# Altium schematic sheet ISP2454-LX_Libraries.SchDoc: ISP2454-LX_SCH
size A3; Organization: Insight SIP; Address1: 400 Avenue de Roumanille; Address2: 06906; Address3: Sophia-Antipolis; Address4: France; DocumentNumber: 1; Revision: 2; SheetNumber: 1; SheetTotal: 1
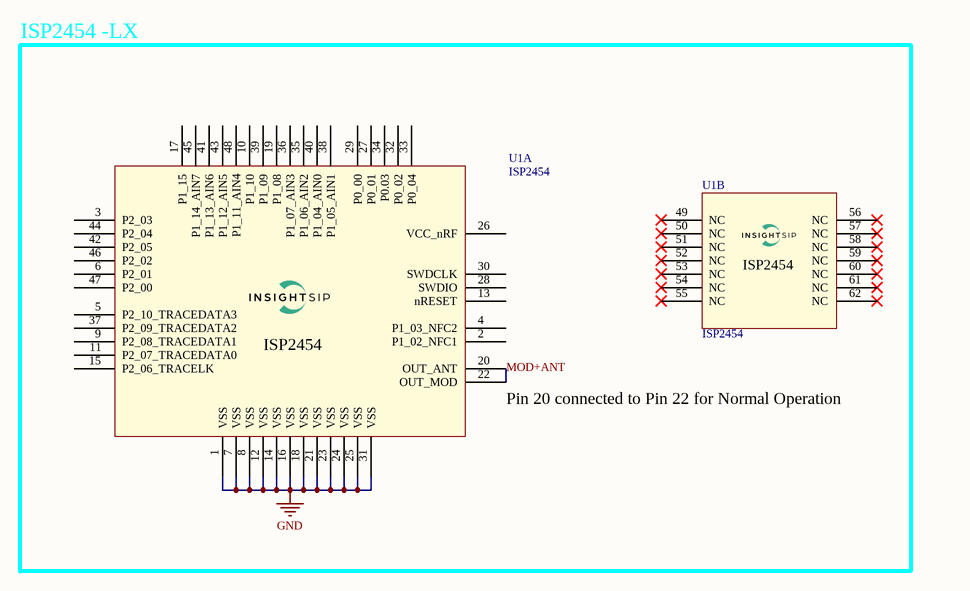
[diagram p0: ISP2454-LX_Libraries.SchDoc]

## Parts
U1  ISP2454  [ISP2454]  (parts A,B of 2)

## Nets
GND: U1.1(VSS) U1.7(VSS) U1.8(VSS) U1.12(VSS) U1.14(VSS) U1.16(VSS) U1.18(VSS) U1.21(VSS) U1.23(VSS) U1.24(VSS) U1.25(VSS) U1.31(VSS)
MOD+ANT: U1.20(OUT_ANT) U1.22(OUT_MOD)

Not connected (* = marked no-connect by the designer): U1 2(P1_02_NFC1) 3(P2_03) 4(P1_03_NFC2) 5(P2_10_TRACEDATA3) 6(P2_01) 9(P2_08_TRACEDATA1) 10(P1_10) 11(P2_07_TRACEDATA0) 13(nRESET) 15(P2_06_TRACELK) 17(P1_15) 19(P1_08) 26(VCC_nRF) 27(P0_01) 28(SWDIO) 29(P0_00) 30(SWDCLK) 32(P0_02) 33(P0_04) 34(P0.03) 35(P1_06_AIN2) 36(P1_07_AIN3) 37(P2_09_TRACEDATA2) 38(P1_05_AIN1) 39(P1_09) 40(P1_04_AIN0) 41(P1_13_AIN6) 42(P2_05) 43(P1_12_AIN5) 44(P2_04) 45(P1_14_AIN7) 46(P2_02) 47(P2_00) 48(P1_11_AIN4) 49(NC)* 50(NC)* 51(NC)* 52(NC)* 53(NC)* 54(NC)* 55(NC)* 56(NC)* 57(NC)* 58(NC)* 59(NC)* 60(NC)* 61(NC)* 62(NC)*

## Notes on the sheet
- ISP2454 -LX
- (near U1) Pin 20 connected to Pin 22 for Normal Operation
- Title
- Size:
- Date:
- A3
- Number:
- Time:
- Revision:
- Sheet
- of
- File:

## Library data of the parts
U1 = ISP2454: ISP2454 ISP module BLE based on nRF54L15; Manufacturer PN: ISP2454-LX; Manufacturer: Insight SiP; Check Lib: OK; ISP PART: ISP2454; Status: Active